# Altium project Ezlo_Voice_AssistantHUB.PrjPcb (part 1 of 10)
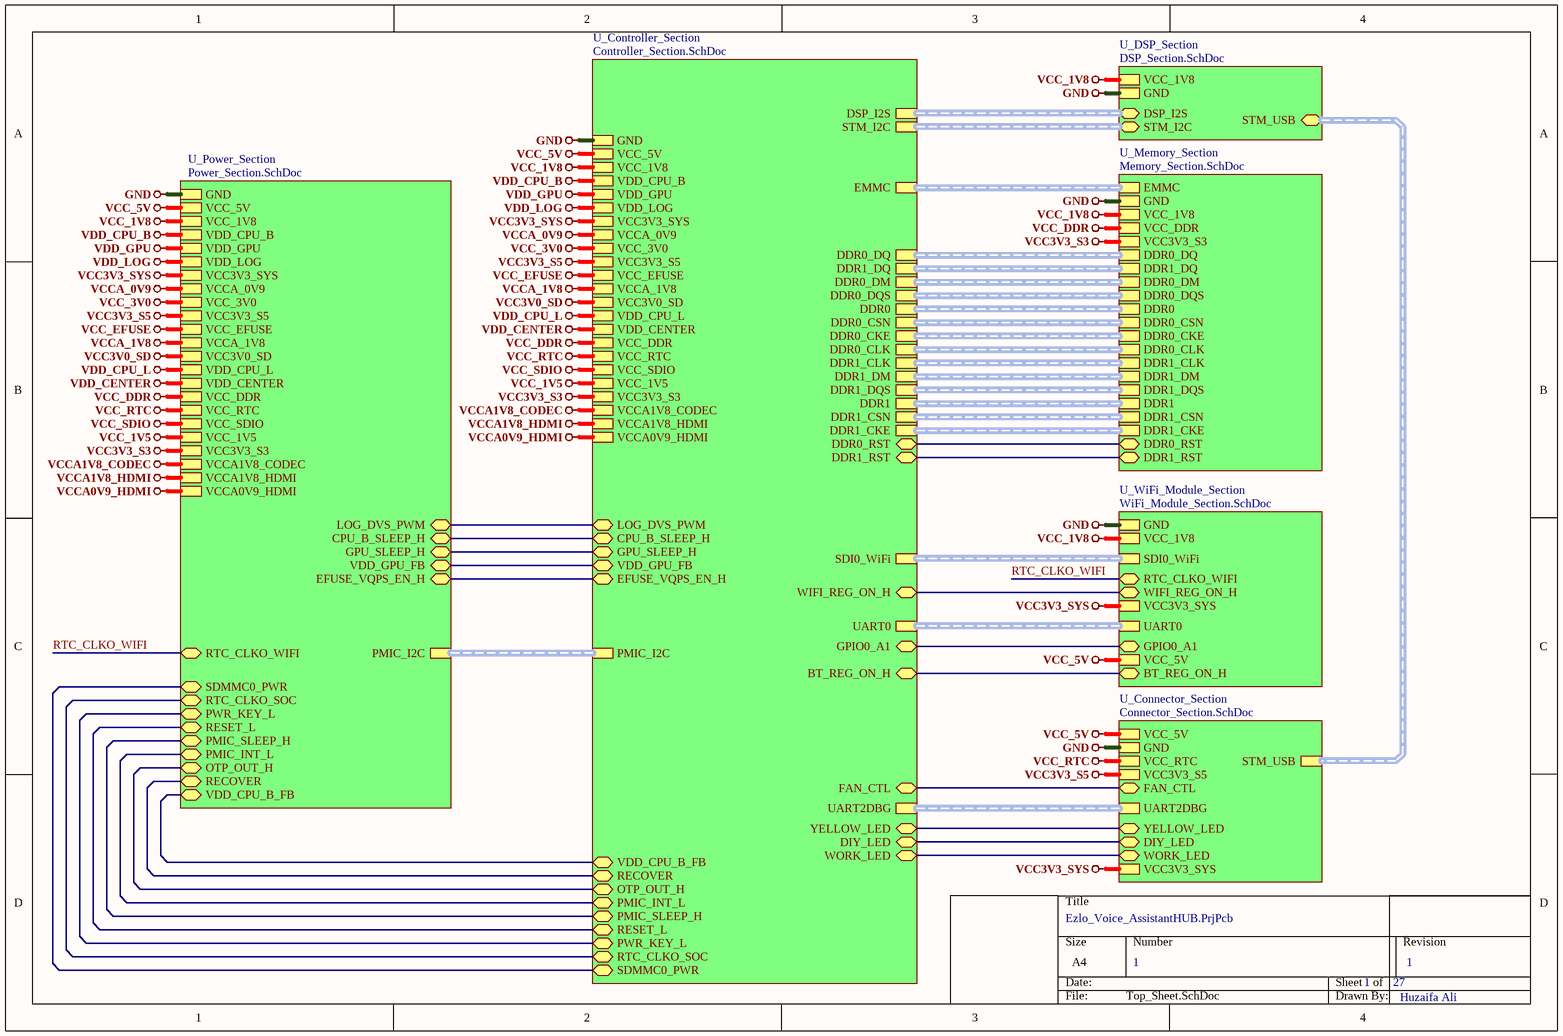
[diagram p0: Top_Sheet.SchDoc]
26 sheets, 569 parts. Net scope: hierarchical (ports join the sheet entries above them; power ports are global).
Board file: VA_HUB_PCB.PcbDoc
Sheets:
  Top_Sheet.SchDoc
    U_DSP_Section = DSP_Section.SchDoc
    U_WiFi_Module_Section = WiFi_Module_Section.SchDoc
    U_Connector_Section = Connector_Section.SchDoc
    U_Power_Section = Power_Section.SchDoc
      U_Power_Sheet_1 = Power_Sheet_1.SchDoc
      U_Power_Sheet_3 = Power_Sheet_3.SchDoc
      U_Power_Sheet_2 = Power_Sheet_2.SchDoc
    U_Controller_Section = Controller_Section.SchDoc
      U_Internal_Power_Sheet = Internal_Power_Sheet.SchDoc
      U_GND_Sheet = GND_Sheet.SchDoc
      U_CameraOrDisplay_Sheet = CameraOrDisplay_Sheet.SchDoc
      U_eMMC_Sheet = eMMC_Sheet.SchDoc
      U_MIPI_Sheet = MIPI_Sheet.SchDoc
      U_PCIe_Sheet = PCIe_Sheet.SchDoc
      U_HDMI_Sheet = HDMI_Sheet.SchDoc
      U_USB_Sheet_2 = USB_Sheet_2.SchDoc
      U_USB_Sheet = USB_Sheet.SchDoc
      U_MISCIO_Sheet = MISCIO_Sheet.SchDoc
      U_Interface_Sheet = Interface_Sheet.SchDoc
      U_SDIO_SDMMC_Sheet = SDIO_SDMMC_Sheet.SchDoc
      U_DDRC_Section = DDRC_Section.SchDoc
      U_DDRC_Sheet_2 = DDRC_Sheet_2.SchDoc
    U_Memory_Section = Memory_Section.SchDoc
      U_Flash_Sheet = Flash_Sheet.SchDoc
      U_RAM_Sheet = RAM_Sheet.SchDoc

## Sheet Top_Sheet.SchDoc
size A4; DocumentNumber: 1; SheetNumber: 1; SheetTotal: 27

### Sub-sheets
U_Connector_Section = Connector_Section.SchDoc: VCC_5V, GND, STM_USB (harness STM_USB), VCC_RTC, VCC3V3_S5, FAN_CTL (bidir), UART2DBG (harness UART2DBG), YELLOW_LED (bidir), DIY_LED (bidir), WORK_LED (bidir), VCC3V3_SYS
U_Controller_Section = Controller_Section.SchDoc: LOG_DVS_PWM (bidir), CPU_B_SLEEP_H (bidir), GPU_SLEEP_H (bidir), VDD_GPU_FB (bidir), EFUSE_VQPS_EN_H (bidir), GND, VCC_5V, VCC_1V8, VDD_CPU_B, VDD_GPU, VDD_LOG, VCC3V3_SYS, VCCA_0V9, VCC_3V0, VCC3V3_S5, VCC_EFUSE, VCCA_1V8, VCC3V0_SD, VDD_CPU_L, VDD_CENTER, VCC_DDR, VCC_RTC, VCC_SDIO, VCC_1V5, VCC3V3_S3, VCCA1V8_CODEC, VCCA1V8_HDMI, VCCA0V9_HDMI, EMMC (harness EMMC), FAN_CTL (bidir), PWR_KEY_L (bidir), PMIC_I2C (harness PMIC_I2C), DSP_I2S (harness DSP_I2S), UART0 (harness UART0), UART2DBG (harness UART2DBG), STM_I2C (harness STM_I2C), OTP_OUT_H (bidir), PMIC_INT_L (bidir), RECOVER (bidir), RTC_CLKO_SOC (bidir), RESET_L (bidir), PMIC_SLEEP_H (bidir), YELLOW_LED (bidir), DIY_LED (bidir), WIFI_REG_ON_H (bidir), GPIO0_A1 (bidir), BT_REG_ON_H (bidir), SDI0_WiFi (harness SDI0_WiFi), WORK_LED (bidir), VDD_CPU_B_FB (bidir), SDMMC0_PWR (bidir), DDR0_DQ, DDR1_DQ, DDR0_DM, DDR0_DQS, DDR0, DDR0_CSN, DDR0_CKE, DDR0_CLK, DDR1_CLK, DDR1_DM, DDR1_DQS, DDR1, DDR1_CSN, DDR1_CKE, DDR0_RST (bidir), DDR1_RST (bidir)
U_DSP_Section = DSP_Section.SchDoc: VCC_1V8, GND, DSP_I2S (bidir, harness DSP_I2S), STM_I2C (bidir, harness STM_I2C), STM_USB (bidir, harness STM_USB)
U_Memory_Section = Memory_Section.SchDoc: EMMC (harness EMMC), GND, VCC_1V8, VCC_DDR, VCC3V3_S3, DDR0_DQ, DDR1_DQ, DDR0_DM, DDR0_DQS, DDR0, DDR0_CSN, DDR0_CKE, DDR0_CLK, DDR1_CLK, DDR1_DM, DDR1_DQS, DDR1, DDR1_CSN, DDR1_CKE, DDR0_RST (bidir), DDR1_RST (bidir)
U_Power_Section = Power_Section.SchDoc: GND, VCC_5V, VCC_1V8, VDD_CPU_B, VDD_GPU, VDD_LOG, VCC3V3_SYS, VCCA_0V9, VCC_3V0, VCC3V3_S5, VCC_EFUSE, VCCA_1V8, VCC3V0_SD, VDD_CPU_L, VDD_CENTER, VCC_DDR, VCC_RTC, VCC_SDIO, VCC_1V5, VCC3V3_S3, VCCA1V8_CODEC, VCCA1V8_HDMI, VCCA0V9_HDMI, PMIC_I2C (harness PMIC_I2C), LOG_DVS_PWM (bidir), CPU_B_SLEEP_H (bidir), GPU_SLEEP_H (bidir), VDD_GPU_FB (bidir), EFUSE_VQPS_EN_H (bidir), RTC_CLKO_WIFI (bidir), RESET_L (bidir), PMIC_SLEEP_H (bidir), PMIC_INT_L (bidir), OTP_OUT_H (bidir), RECOVER (bidir), VDD_CPU_B_FB (bidir), PWR_KEY_L (bidir), RTC_CLKO_SOC (bidir), SDMMC0_PWR (bidir)
U_WiFi_Module_Section = WiFi_Module_Section.SchDoc: GND, VCC_1V8, SDI0_WiFi (harness SDI0_WiFi), RTC_CLKO_WIFI (bidir), WIFI_REG_ON_H (bidir), VCC3V3_SYS, UART0 (harness UART0), GPIO0_A1 (bidir), VCC_5V, BT_REG_ON_H (bidir)

### Nets
GND: sheet U_DSP_Section/GND, sheet U_WiFi_Module_Section/GND, sheet U_Connector_Section/GND, sheet U_Power_Section/GND, sheet U_Controller_Section/GND, sheet U_Memory_Section/GND
VCC3V0_SD: sheet U_Power_Section/VCC3V0_SD, sheet U_Controller_Section/VCC3V0_SD
VCC3V3_S3: sheet U_Power_Section/VCC3V3_S3, sheet U_Controller_Section/VCC3V3_S3, sheet U_Memory_Section/VCC3V3_S3
VCC3V3_S5: sheet U_Connector_Section/VCC3V3_S5, sheet U_Power_Section/VCC3V3_S5, sheet U_Controller_Section/VCC3V3_S5
VCC3V3_SYS: sheet U_WiFi_Module_Section/VCC3V3_SYS, sheet U_Connector_Section/VCC3V3_SYS, sheet U_Power_Section/VCC3V3_SYS, sheet U_Controller_Section/VCC3V3_SYS
VCC_1V5: sheet U_Power_Section/VCC_1V5, sheet U_Controller_Section/VCC_1V5
VCC_1V8: sheet U_DSP_Section/VCC_1V8, sheet U_WiFi_Module_Section/VCC_1V8, sheet U_Power_Section/VCC_1V8, sheet U_Controller_Section/VCC_1V8, sheet U_Memory_Section/VCC_1V8
VCC_3V0: sheet U_Power_Section/VCC_3V0, sheet U_Controller_Section/VCC_3V0
VCC_5V: sheet U_WiFi_Module_Section/VCC_5V, sheet U_Connector_Section/VCC_5V, sheet U_Power_Section/VCC_5V, sheet U_Controller_Section/VCC_5V
VCC_DDR: sheet U_Power_Section/VCC_DDR, sheet U_Controller_Section/VCC_DDR, sheet U_Memory_Section/VCC_DDR
VCC_EFUSE: sheet U_Power_Section/VCC_EFUSE, sheet U_Controller_Section/VCC_EFUSE
VCC_RTC: sheet U_Connector_Section/VCC_RTC, sheet U_Power_Section/VCC_RTC, sheet U_Controller_Section/VCC_RTC
VCC_SDIO: sheet U_Power_Section/VCC_SDIO, sheet U_Controller_Section/VCC_SDIO
VCCA0V9_HDMI: sheet U_Power_Section/VCCA0V9_HDMI, sheet U_Controller_Section/VCCA0V9_HDMI
VCCA1V8_CODEC: sheet U_Power_Section/VCCA1V8_CODEC, sheet U_Controller_Section/VCCA1V8_CODEC
VCCA1V8_HDMI: sheet U_Power_Section/VCCA1V8_HDMI, sheet U_Controller_Section/VCCA1V8_HDMI
VCCA_0V9: sheet U_Power_Section/VCCA_0V9, sheet U_Controller_Section/VCCA_0V9
VCCA_1V8: sheet U_Power_Section/VCCA_1V8, sheet U_Controller_Section/VCCA_1V8
VDD_CENTER: sheet U_Power_Section/VDD_CENTER, sheet U_Controller_Section/VDD_CENTER
VDD_CPU_B: sheet U_Power_Section/VDD_CPU_B, sheet U_Controller_Section/VDD_CPU_B
VDD_CPU_L: sheet U_Power_Section/VDD_CPU_L, sheet U_Controller_Section/VDD_CPU_L
VDD_GPU: sheet U_Power_Section/VDD_GPU, sheet U_Controller_Section/VDD_GPU
VDD_LOG: sheet U_Power_Section/VDD_LOG, sheet U_Controller_Section/VDD_LOG
BT_REG_ON_H: sheet U_WiFi_Module_Section/BT_REG_ON_H, sheet U_Controller_Section/BT_REG_ON_H
CPU_B_SLEEP_H: sheet U_Power_Section/CPU_B_SLEEP_H, sheet U_Controller_Section/CPU_B_SLEEP_H
DDR0_RST: sheet U_Controller_Section/DDR0_RST, sheet U_Memory_Section/DDR0_RST
DDR1_RST: sheet U_Controller_Section/DDR1_RST, sheet U_Memory_Section/DDR1_RST
DIY_LED: sheet U_Connector_Section/DIY_LED, sheet U_Controller_Section/DIY_LED
EFUSE_VQPS_EN_H: sheet U_Power_Section/EFUSE_VQPS_EN_H, sheet U_Controller_Section/EFUSE_VQPS_EN_H
FAN_CTL: sheet U_Connector_Section/FAN_CTL, sheet U_Controller_Section/FAN_CTL
GPIO0_A1: sheet U_WiFi_Module_Section/GPIO0_A1, sheet U_Controller_Section/GPIO0_A1
GPU_SLEEP_H: sheet U_Power_Section/GPU_SLEEP_H, sheet U_Controller_Section/GPU_SLEEP_H
LOG_DVS_PWM: sheet U_Power_Section/LOG_DVS_PWM, sheet U_Controller_Section/LOG_DVS_PWM
OTP_OUT_H: sheet U_Power_Section/OTP_OUT_H, sheet U_Controller_Section/OTP_OUT_H
PMIC_INT_L: sheet U_Power_Section/PMIC_INT_L, sheet U_Controller_Section/PMIC_INT_L
PMIC_SLEEP_H: sheet U_Power_Section/PMIC_SLEEP_H, sheet U_Controller_Section/PMIC_SLEEP_H
PWR_KEY_L: sheet U_Power_Section/PWR_KEY_L, sheet U_Controller_Section/PWR_KEY_L
RECOVER: sheet U_Power_Section/RECOVER, sheet U_Controller_Section/RECOVER
RESET_L: sheet U_Power_Section/RESET_L, sheet U_Controller_Section/RESET_L
RTC_CLKO_SOC: sheet U_Power_Section/RTC_CLKO_SOC, sheet U_Controller_Section/RTC_CLKO_SOC
RTC_CLKO_WIFI: sheet U_WiFi_Module_Section/RTC_CLKO_WIFI, sheet U_Power_Section/RTC_CLKO_WIFI
SDMMC0_PWR: sheet U_Power_Section/SDMMC0_PWR, sheet U_Controller_Section/SDMMC0_PWR
VDD_CPU_B_FB: sheet U_Power_Section/VDD_CPU_B_FB, sheet U_Controller_Section/VDD_CPU_B_FB
VDD_GPU_FB: sheet U_Power_Section/VDD_GPU_FB, sheet U_Controller_Section/VDD_GPU_FB
WIFI_REG_ON_H: sheet U_WiFi_Module_Section/WIFI_REG_ON_H, sheet U_Controller_Section/WIFI_REG_ON_H
WORK_LED: sheet U_Connector_Section/WORK_LED, sheet U_Controller_Section/WORK_LED
YELLOW_LED: sheet U_Connector_Section/YELLOW_LED, sheet U_Controller_Section/YELLOW_LED

### Buses and harness runs
harness sheet U_Connector_Section/STM_USB = sheet U_DSP_Section/STM_USB
harness sheet U_Connector_Section/UART2DBG = sheet U_Controller_Section/UART2DBG
harness sheet U_Controller_Section/DDR0 = sheet U_Memory_Section/DDR0
harness sheet U_Controller_Section/DDR0_CKE = sheet U_Memory_Section/DDR0_CKE
harness sheet U_Controller_Section/DDR0_CLK = sheet U_Memory_Section/DDR0_CLK
harness sheet U_Controller_Section/DDR0_CSN = sheet U_Memory_Section/DDR0_CSN
harness sheet U_Controller_Section/DDR0_DM = sheet U_Memory_Section/DDR0_DM
harness sheet U_Controller_Section/DDR0_DQ = sheet U_Memory_Section/DDR0_DQ
harness sheet U_Controller_Section/DDR0_DQS = sheet U_Memory_Section/DDR0_DQS
harness sheet U_Controller_Section/DDR1 = sheet U_Memory_Section/DDR1
harness sheet U_Controller_Section/DDR1_CKE = sheet U_Memory_Section/DDR1_CKE
harness sheet U_Controller_Section/DDR1_CLK = sheet U_Memory_Section/DDR1_CLK
harness sheet U_Controller_Section/DDR1_CSN = sheet U_Memory_Section/DDR1_CSN
harness sheet U_Controller_Section/DDR1_DM = sheet U_Memory_Section/DDR1_DM
harness sheet U_Controller_Section/DDR1_DQ = sheet U_Memory_Section/DDR1_DQ
harness sheet U_Controller_Section/DDR1_DQS = sheet U_Memory_Section/DDR1_DQS
harness sheet U_Controller_Section/DSP_I2S = sheet U_DSP_Section/DSP_I2S
harness sheet U_Controller_Section/EMMC = sheet U_Memory_Section/EMMC
harness sheet U_Controller_Section/PMIC_I2C = sheet U_Power_Section/PMIC_I2C
harness sheet U_Controller_Section/SDI0_WiFi = sheet U_WiFi_Module_Section/SDI0_WiFi
harness sheet U_Controller_Section/STM_I2C = sheet U_DSP_Section/STM_I2C
harness sheet U_Controller_Section/UART0 = sheet U_WiFi_Module_Section/UART0

### Notes on the sheet
- 1
- Huzaifa Ali

## Sheet DSP_Section.SchDoc
size A4; DocumentNumber: 22; SheetNumber: 22; SheetTotal: 27
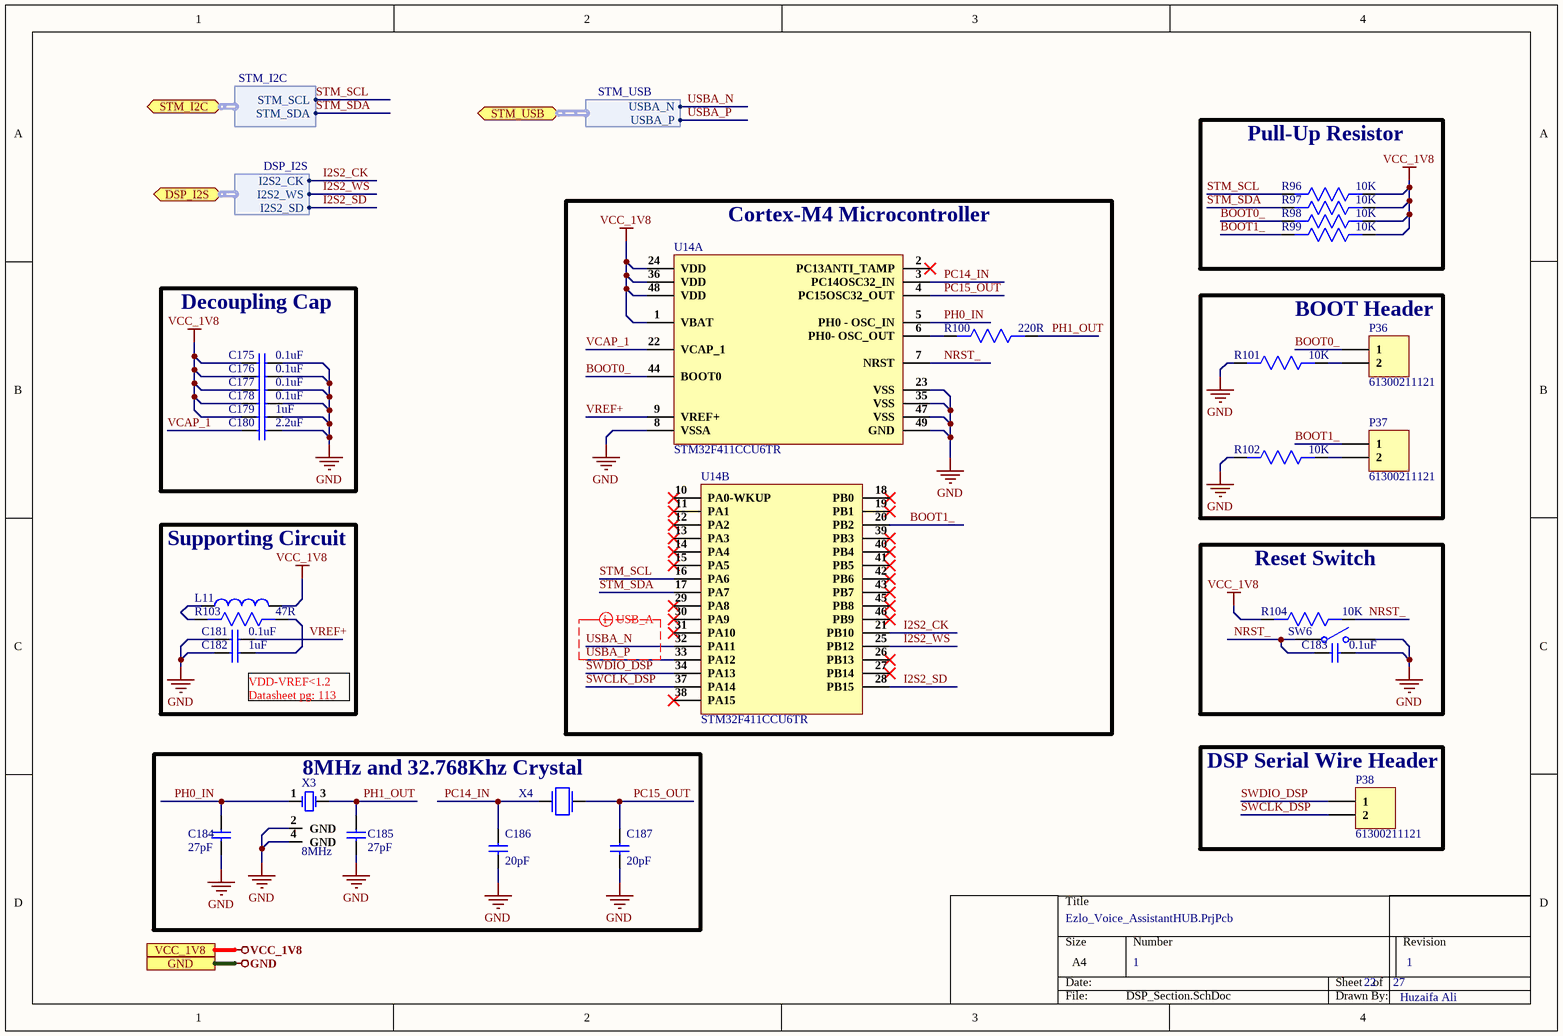
[diagram p1: DSP_Section.SchDoc]

### Parts
C175  0.1uF  [Cap0402]
C176  0.1uF  [Cap0402]
C177  0.1uF  [Cap0402]
C178  0.1uF  [Cap0402]
C179  1uF  [Cap0402]
C180  2.2uF  [Cap0603]
C181  0.1uF  [Cap0402]
C182  1uF  [Cap0402]
C183  0.1uF  [Cap0402]
C184  27pF  [Cap0603]
C185  27pF  [Cap0603]
C186  20pF  [Cap0603]
C187  20pF  [Cap0603]
L11  BLM15AG601SN1D  [IND 0402]  (value not drawn)
P36  61300211121  [HDR1X2]
P37  61300211121  [HDR1X2]
P38  61300211121  [HDR1X2]
R96  10K  [Res0603]
R97  10K  [Res0603]
R98  10K  [Res0603]
R99  10K  [Res0603]
R100  220R  [Res0603]
R101  10K  [Res0603]
R102  10K  [Res0603]
R103  47R  [Res0603]
R104  10K  [Res0603]
SW6  TS-1185EC-C-D-B  [TS-1185EC-C-D-B]  (value not drawn)
U14  STM32F411CCU6TR  [48-UFQFPN (7x7)]  (parts A,B of 2)
X3  8MHz  [5TJ480000XYLBC]
X4  NX3215SA-32.768K-STD-MUA-8  [NX3215SA-32.768K-STD-MUA-8]  (value not drawn)

### Blocks framed on the sheet
Pull-Up Resistor: R96-R99
Cortex-M4 Microcontroller: R100 U14
Decoupling Cap: C175-C180
BOOT Header: P36 P37 R101 R102
Supporting Circuit: C181 C182 L11 R103
Reset Switch: C183 R104 SW6
8MHz and 32.768Khz Crystal: C184-C187 X3 X4
DSP Serial Wire Header: P38

### Ports
DSP_I2S (bidir, harness DSP_I2S), GND, STM_I2C (bidir, harness STM_I2C), STM_USB (bidir, harness STM_USB), VCC_1V8

### Harnesses
DSP_I2S: I2S2_CK, I2S2_WS, I2S2_SD
STM_I2C: STM_SCL, STM_SDA
STM_USB: USBA_N, USBA_P

### Nets
GND: C175.2 C176.2 C177.2 C178.2 C179.2 C180.2 C181.1 C182.1 C183.2 C184.1 C185.1 C186.1 C187.1 R101.2 R102.2 SW6.2 U14.8(VSSA) U14.23(VSS) U14.35(VSS) U14.47(VSS) U14.49(GND) X3.2(GND) X3.4(GND) ; port GND
VCC_1V8: C175.1 C176.1 C177.1 C178.1 C179.1 L11.2 R96.1 R97.1 R98.1 R99.1 R104.2 U14.1(VBAT) U14.24(VDD) U14.36(VDD) U14.48(VDD) ; port VCC_1V8
BOOT0_: P36.1 R98.2 U14.44(BOOT0)
BOOT1_: P37.1 R99.2 U14.20(PB2)
I2S2_CK: U14.21(PB10) ; port DSP_I2S.I2S2_CK  [project net DSP_I2S.I2S2_CK]
I2S2_SD: U14.28(PB15) ; port DSP_I2S.I2S2_SD  [project net DSP_I2S.I2S2_SD]
I2S2_WS: U14.25(PB12) ; port DSP_I2S.I2S2_WS  [project net DSP_I2S.I2S2_WS]
NRST_: C183.1 R104.1 SW6.1 U14.7(NRST)
PC14_IN: C186.2 U14.3(PC14OSC32_IN) X4.2
PC15_OUT: C187.2 U14.4(PC15OSC32_OUT) X4.1
PH0_IN: C184.2 U14.5(PH0_-_OSC_IN) X3.1(OSC1)
PH1_OUT: C185.2 R100.1 X3.3(OSC2)
STM_SCL: R96.2 U14.16(PA6) ; port STM_I2C.STM_SCL  [project net STM_I2C.STM_SCL]
STM_SDA: R97.2 U14.17(PA7) ; port STM_I2C.STM_SDA  [project net STM_I2C.STM_SDA]
SWCLK_DSP: P38.2 U14.37(PA14)
SWDIO_DSP: P38.1 U14.34(PA13)
USBA_N: U14.32(PA11) ; port STM_USB.USBA_N
USBA_P: U14.33(PA12) ; port STM_USB.USBA_P
VCAP_1: C180.1 U14.22(VCAP_1)
VREF+: C181.2 U14.9(VREF+)
NetC182_2: C182.2 R103.1
NetL11_1: L11.1 R103.2
NetP36_2: P36.2 R101.1
NetP37_2: P37.2 R102.1
NetR100_2: R100.2 U14.6(PH0-_OSC_OUT)

Not connected (* = marked no-connect by the designer): U14 2(PC13ANTI_TAMP)* 10(PA0-WKUP)* 11(PA1)* 12(PA2)* 13(PA3)* 14(PA4)* 15(PA5)* 18(PB0)* 19(PB1)* 26(PB13)* 27(PB14)* 29(PA8)* 30(PA9)* 31(PA10)* 38(PA15)* 39(PB3)* 40(PB4)* 41(PB5)* 42(PB6)* 43(PB7)* 45(PB8)* 46(PB9)*

### Layout directives
differential pair; rule Matched Net Lengths [Tolerance = 50mil]; rule Impedance Constraint [Min = 85.00    Max = 95.00    ]; differential pair class USB_A_Lines; net class USB_A: USBA_N, USBA_P

### Notes on the sheet
- VDD-VREF<1.2
  Datasheet pg: 113
- 1
- Huzaifa Ali

### Library data of the parts
C175-C178 C181 C183 = CC0402KRX5R6BB104: CAP CER 0.1UF 10V X5R 0402; Manufacturer: Yageo; Capacitance: 100nF; Tolerance: 10%; Dissipation Factor: 5%; Insulation Resistance: 10GR; Supplier 1: Digi-Key; Manufacturer Part Number: CC0402KRX5R6BB104; RoHS: Yes; Category: Ceramic Capacitors; Stock 1: 6385580; Pricing 1: 1=0.10000, 10=0.02700, 50=0.01500, 100=0.01220, 500=0.00874, 1000=0.00687, 2500=0.00625, 5000=0.00575 (USD); Mount: Surface Mount; Case/Package: 0402; Number of Pins: 2; Case Code (Imperial): 0402; Case Code (Metric): 1005; Min Operating Temperature: -55°C; Max Operating Temperature: 85°C; Dielectric: X5R; Packaging: Tape and Reel; Voltage Rating: 10V; Package Quantity: 1; Termination: SMD/SMT; Voltage Rating (DC): 10V; Series: CC; Length: 1mm; Width: 0.02inch; Height: 0.5mm; Depth: 0.5mm; Thickness: 0.022inch; Radiation Hardening: No; RoHS Compliant: Yes; REACH SVHC: No SVHC; Lead Free: Lead Free; Halogen Free: Halogen Free; ComponentLink1URL: https://datasheet.ciiva.com/144/mlccorderingcode-144029.pdf?src-supplier=Digi-Key; ComponentLink1Description: https://datasheet.ciiva.com/144/mlccorderingcode-144029.pdf?src-supplier=Digi-Key; ComponentLink2URL: https://datasheet.ciiva.com/144/mlccorderingcode-144028.pdf?src-supplier=Digi-Key; ComponentLink2Description: https://datasheet.ciiva.com/144/mlccorderingcode-144028.pdf?src-supplier=Digi-Key; ComponentLink3URL: https://datasheet.ciiva.com/144/mlccorderingcode-144030.pdf?src-supplier=Digi-Key; ComponentLink3Description: https://datasheet.ciiva.com/144/mlccorderingcode-144030.pdf?src-supplier=Digi-Key; ComponentLink4URL: https://datasheet.ciiva.com/7978/1359354-7978091.pdf?src-supplier=Element14; ComponentLink4Description: https://datasheet.ciiva.com/7978/1359354-7978091.pdf?src-supplier=Element14; ComponentLink5URL: https://datasheet.ciiva.com/11587/upy-gphc-x5r-4v-to-50v-12-11587302.pdf?src-supplier=Avnet; ComponentLink5Description: https://datasheet.ciiva.com/11587/upy-gphc-x5r-4v-to-50v-12-11587302.pdf?src-supplier=Avnet; Supplier Part Number 1: 311-1336-1-ND
C179 C182 = GRM155R61E105KA12D: CAP CER 1UF 25V X5R 0402; Manufacturer: Murata; Material: Ceramic; Tolerance: 10%; Supplier 1: Digi-Key; Manufacturer Part Number: GRM155R61E105KA12D; Stock 1: 1194305; Pricing 1: 1=0.11, 10=0.077, 100=0.0363, 500=0.02546, 1000=0.02108, 2500=0.01962, 5000=0.01795 (USD); Mount: Surface Mount; Case/Package: 0402; Weight: 0.000212oz; Case Code (Metric): 1005; Case Code (Imperial): 0402; Min Operating Temperature: -55°C; Max Operating Temperature: 85°C; Capacitance: 1uF; Voltage Rating: 25V; Packaging: Tape and Reel; Dielectric: X5R; Voltage: 25V; Termination: SMD/SMT; Voltage Rating (DC): 25V; Package Quantity: 10000; Length: 1mm; Height: 0.5mm; Width: 0.5mm; Thickness: 0.022inch; Depth: 0.5mm; REACH SVHC: No SVHC; Lead Free: Lead Free; ComponentLink1URL: http://www.farnell.com/datasheets/2048341.pdf?src-supplier=Element14; ComponentLink1Description: http://www.farnell.com/datasheets/2048341.pdf?src-supplier=Element14; Supplier Part Number 1: 490-10017-1-ND
C180 = CL10A225KA8NNNC: CAP CER 2.2UF 25V X5R 0603; Manufacturer: Samsung; Tolerance: 10%; Supplier 1: Digi-Key; Manufacturer Part Number: CL10A225KA8NNNC; RoHS: Yes; Category: Ceramic Capacitors; Stock 1: 168888; Pricing 1: 1=0.22000, 10=0.15000, 50=0.09000, 100=0.07610, 500=0.05206, 1000=0.04605 (USD); Mount: Surface Mount; Case/Package: 0603; Case Code (Metric): 1608; Case Code (Imperial): 0603; Min Operating Temperature: -55°C; Max Operating Temperature: 85°C; Capacitance: 2.2uF; Packaging: Tape and Reel; Package Quantity: 1; Voltage Rating: 25V; Dielectric: X5R; Voltage Rating (DC): 25V; Series: CL; Construction: Flat; Length: 1.6mm; Width: 0.031inch; Height: 0.8mm; Thickness: 0.035inch; Depth: 0.8mm; Radiation Hardening: No; Lead Free: Lead Free; RoHS Compliant: Yes; ComponentLink1URL: https://datasheet.ciiva.com/25797/cl10a225ka8nnnc-25797781.pdf?src-supplier=Digi-Key; ComponentLink1Description: https://datasheet.ciiva.com/25797/cl10a225ka8nnnc-25797781.pdf?src-supplier=Digi-Key; Supplier Part Number 1: 1276-1879-1-ND
C184 C185 = CC0603JRNPO9BN270: CAP CER 27pF 5% C0G 50V 0603 Paper T/R; Manufacturer: Yageo; Dielectric Material: Ceramic; Tolerance: 10%; Temperature Coefficient: 0ppm/°C; Insulation Resistance: 100GR; Supplier 1: Arrow Electronics; Manufacturer Part Number: CC0603JRNPO9BN270; RoHS: Yes; Category: Ceramic Capacitors; Stock 1: 16000; Pricing 1: 4000=0.00800, 8000=0.00610 (USD); Mount: Surface Mount; Case/Package: 0603; Number of Pins: 2; Case Code (Metric): 1608; Case Code (Imperial): 0603; Min Operating Temperature: -55°C; Max Operating Temperature: 125°C; Capacitance: 27pF; Dielectric: C0G; Package Quantity: 1; Voltage Rating: 50V; Packaging: Tape and Reel; Voltage Rating (DC): 50V; Termination: SMD/SMT; Resistor Type: Ceramic; Voltage: 50V; Series: CC; Length: 1.6mm; Width: 0.031inch; Height: 0.8mm; Thickness: 0.035inch; Depth: 0.8mm; Radiation Hardening: No; REACH SVHC: Unknown; Lead Free: Lead Free; RoHS Compliant: Yes; ComponentLink1URL: https://datasheet.ciiva.com/26862/getdatasheetpartid-403529-26862764.pdf?src-supplier=Verical; ComponentLink1Description: https://datasheet.ciiva.com/26862/getdatasheetpartid-403529-26862764.pdf?src-supplier=Verical; ComponentLink2URL: https://datasheet.ciiva.com/8033/1443161-8033757.pdf?src-supplier=Element14; ComponentLink2Description: https://datasheet.ciiva.com/8033/1443161-8033757.pdf?src-supplier=Element14; ComponentLink3URL: https://datasheet.ciiva.com/46430/1835847-46430154.pdf?src-supplier=Element14; ComponentLink3Description: https://datasheet.ciiva.com/46430/1835847-46430154.pdf?src-supplier=Element14; ComponentLink4URL: https://datasheet.ciiva.com/144/mlccorderingcode-144641.pdf?src-supplier=Digi-Key; ComponentLink4Description: https://datasheet.ciiva.com/144/mlccorderingcode-144641.pdf?src-supplier=Digi-Key; ComponentLink5URL: https://datasheet.ciiva.com/144/mlccorderingcode-144640.pdf?src-supplier=Digi-Key; ComponentLink5Description: https://datasheet.ciiva.com/144/mlccorderingcode-144640.pdf?src-supplier=Digi-Key; ComponentLink6URL: https://datasheet.ciiva.com/144/mlccorderingcode-144642.pdf?src-supplier=Digi-Key; ComponentLink6Description: https://datasheet.ciiva.com/144/mlccorderingcode-144642.pdf?src-supplier=Digi-Key; ComponentLink7URL: https://datasheet.ciiva.com/8033/1734582-8033726.pdf?src-supplier=Element14; ComponentLink7Description: https://datasheet.ciiva.com/8033/1734582-8033726.pdf?src-supplier=Element14; ComponentLink8URL: https://datasheet.ciiva.com/8033/1734582-8033725.pdf?src-supplier=Element14; ComponentLink8Description: https://datasheet.ciiva.com/8033/1734582-8033725.pdf?src-supplier=Element14; ComponentLink9URL: https://datasheet.ciiva.com/11464/upy-gp-np0-16v-to-50v-8-11464729.pdf?src-supplier=Avnet; ComponentLink9Description: https://datasheet.ciiva.com/11464/upy-gp-np0-16v-to-50v-8-11464729.pdf?src-supplier=Avnet; Supplier Part Number 1: CC0603JRNPO9BN270
C186 C187 = CC0603JRNPO9BN200: CAP CER 20PF 50V C0G/NPO 0603; Manufacturer: Yageo; Tolerance: 5%; Dielectric: C0G; Supplier 1: Digi-Key; Manufacturer Part Number: CC0603JRNPO9BN200; Stock 1: 259568; Pricing 1: 1=0.1, 10=0.048, 100=0.0214, 500=0.01526, 1000=0.01198 (USD); Mount: Surface Mount; Case/Package: 0603; Number of Pins: 2; Weight: 7.1E-05oz; Case Code (Imperial): 0603; Case Code (Metric): 1608; Min Operating Temperature: -55°C; Max Operating Temperature: 125°C; Capacitance: 20pF; Package Quantity: 4000; Voltage Rating (DC): 50V; Packaging: Tape and Reel; Voltage Rating: 50V; Termination: SMD/SMT; Composition: Ceramic; Length: 1.6mm; Width: 0.8mm; Thickness: 0.035inch; Depth: 0.8mm; REACH SVHC: Unknown; Lead Free: Lead Free; ComponentLink1URL: http://www.farnell.com/datasheets/1132289.pdf?src-supplier=Element14; ComponentLink1Description: http://www.farnell.com/datasheets/1132289.pdf?src-supplier=Element14; ComponentLink2URL: http://www.yageo.com/documents/recent/UPY-GP_NP0_16V-to-50V_16.pdf?src-supplier=Digi-Key; ComponentLink2Description: http://www.yageo.com/documents/recent/UPY-GP_NP0_16V-to-50V_16.pdf?src-supplier=Digi-Key; Supplier Part Number 1: 311-1424-6-ND
L11 = BLM15AG601SN1D: Ferrite Beads Multi-Layer 600Ohm 25% 100MHz 300mA 520mOhm DCR 0402 Paper T/R; Manufacturer: Murata; Material: Steel,Ferrite; Impedance: 600R; DC Resistance (DCR): 520mR; Number of Lines: 1; Shielding: Unshielded; DC Resistance-Max: 600mR; Supplier 1: Digi-Key; Manufacturer Part Number: BLM15AG601SN1D; RoHS: Yes; Category: Inductors; Stock 1: 4108655; Pricing 1: 1=0.10000, 10=0.06500, 25=0.05760, 50=0.05240, 100=0.04710, 250=0.03456, 500=0.02514, 1000=0.02461, 5000=0.01676 (USD); Case/Package: 0402; Number of Pins: 2; Core Material: Ferrite; Case Code (Metric): 1005; Case Code (Imperial): 0402; Min Operating Temperature: -55°C; Max Operating Temperature: 125°C; Tolerance: 25%; Max DC Current: 300mA; Package Quantity: 10000; Packaging: Tape and Reel; Current Rating: 300mA; Max Current Rating: 300mA; Termination: SMD/SMT; Test Frequency: 100MHz; DC Current: 300mA; Frequency: 100MHz; Number of Circuits: 1; Series: BLM15AG_SN; Length: 1mm; Width: 0.5mm; Height: 0.5mm; Depth: 0.55mm; Radiation Hardening: No; REACH SVHC: No SVHC; Military Standard: Not; Lead Free: Lead Free; RoHS Compliant: Yes; ComponentLink1URL: https://datasheet.ciiva.com/11799/0900766b811b5866-11799226.pdf?src-supplier=RSComponents; ComponentLink1Description: https://datasheet.ciiva.com/11799/0900766b811b5866-11799226.pdf?src-supplier=RSComponents; ComponentLink2URL: https://datasheet.ciiva.com/41449/001172163-da-01-en-drossel-0402-600r-1-0x0-5mm-10000st-41449450.pdf?src-supplier=Conrad; ComponentLink2Description: https://datasheet.ciiva.com/41449/001172163-da-01-en-drossel-0402-600r-1-0x0-5mm-10000st-41449450.pdf?src-supplier=Conrad; ComponentLink3URL: https://datasheet.ciiva.com/29347/442210-da-01-en-chip-drossel-0402-600r-300ma-1-0x0-5mm-29347879.pdf?src-supplier=Conrad; ComponentLink3Description: https://datasheet.ciiva.com/29347/442210-da-01-en-chip-drossel-0402-600r-300ma-1-0x0-5mm-29347879.pdf?src-supplier=Conrad; ComponentLink4URL: https://datasheet.ciiva.com/1466/5144-1466744.pdf?src-supplier=Element14; ComponentLink4Description: https://datasheet.ciiva.com/1466/5144-1466744.pdf?src-supplier=Element14; ComponentLink5URL: https://datasheet.ciiva.com/1466/5144-1466745.pdf?src-supplier=Element14; ComponentLink5Description: https://datasheet.ciiva.com/1466/5144-1466745.pdf?src-supplier=Element14; ComponentLink6URL: https://datasheet.ciiva.com/14122/blm-series-eng-tds-14122894.pdf?src-supplier=Distrelec; ComponentLink6Description: https://datasheet.ciiva.com/14122/blm-series-eng-tds-14122894.pdf?src-supplier=Distrelec; ComponentLink7URL: https://datasheet.ciiva.com/6212/l0110s0100blm15ag-sn-6212519.pdf?src-supplier=Digi-Key; ComponentLink7Description: https://datasheet.ciiva.com/6212/l0110s0100blm15ag-sn-6212519.pdf?src-supplier=Digi-Key; ComponentLink8URL: https://datasheet.ciiva.com/6212/l0110s0100blm15ag-sn-6212565.pdf?src-supplier=Digi-Key; ComponentLink8Description: https://datasheet.ciiva.com/6212/l0110s0100blm15ag-sn-6212565.pdf?src-supplier=Digi-Key; ComponentLink9URL: https://datasheet.ciiva.com/6212/l0110s0100blm15ag-sn-6212520.pdf?src-supplier=Digi-Key; ComponentLink9Description: https://datasheet.ciiva.com/6212/l0110s0100blm15ag-sn-6212520.pdf?src-supplier=Digi-Key; ComponentLink10URL: https://datasheet.ciiva.com/8084/l0110s0100blm15ag-sn-8084271.pdf?src-supplier=Avnet; ComponentLink10Description: https://datasheet.ciiva.com/8084/l0110s0100blm15ag-sn-8084271.pdf?src-supplier=Avnet; ComponentLink11URL: https://datasheet.ciiva.com/8510/l0110s0100blm15ag-sn-8510909.pdf?src-supplier=Avnet; ComponentLink11Description: https://datasheet.ciiva.com/8510/l0110s0100blm15ag-sn-8510909.pdf?src-supplier=Avnet; Supplier Part Number 1: 490-1006-1-ND
P36-P38 = 61300211121: CONN HEADER VERT 2POS 2.54MM; Manufacturer: Wurth Electronics; Current Rating: 3A; Voltage Rating: 250V; Number of Positions: 2; Gender: Male; Connector Type: Male Pin; Pitch: 0.1inch; Supplier 1: Digi-Key; Manufacturer Part Number: 61300211121; Stock 1: 219205; Pricing 1: 1=0.13, 10=0.106, 25=0.088, 50=0.074, 100=0.067, 1000=0.061 (USD); Mount: Through Hole; Contact Plating: Gold; Housing Material: PBT; Contact Material: Copper Alloy,Copper; Color: Black; Min Operating Temperature: -40°C; Max Operating Temperature: 125°C; Number of Rows: 1; Contact Gender: Male; Packaging: Bulk; Termination: Through Hole; Number of Contacts: 2; Contact Mating Length: 0.236inch; REACH SVHC: Unknown; Lead Free: Lead Free; ComponentLink1URL: http://www.mouser.com/ds/2/445/6130xx11121-538006.pdf?src-supplier=Mouser; ComponentLink1Description: http://www.mouser.com/ds/2/445/6130xx11121-538006.pdf?src-supplier=Mouser; Supplier Part Number 1: 732-5315-ND
R96-R99 R101 R102 R104 = AC0603JR-0710KL: RES SMD 10K OHM 5% 1/10W 0603; Manufacturer: Yageo; Voltage Rating: 50V; Resistance: 10kR; Power Rating: 100mW; Temperature Coefficient: 100ppm/°C; Supplier 1: Future Electronics; Manufacturer Part Number: AC0603JR-0710KL; RoHS: Yes; Category: Chip SMD Resistors; Stock 1: 1533000; Pricing 1: 5000=0.00540 (USD); Case/Package: 0603; Case Code (Imperial): 0603; Case Code (Metric): 1608; Size Code: 0603; Min Operating Temperature: -55°C; Max Operating Temperature: 155°C; Packaging: Tape and Reel; Tolerance: 5%; Package Quantity: 1; Resistor Type: Thick Film; Termination: SMD/SMT; Number of Terminations: 2; Max Power Dissipation: 100mW; Features: Moisture Resistant,Automotive AEC-Q200,Anti-Sulfur; Series: AC; Construction: Rectangular; Length: 0.063inch; Width: 0.031inch; Height: 0.022inch; Depth: 0.8mm; Military Standard: Not; Lead Free: Lead Free; RoHS Compliant: Yes; ComponentLink1URL: https://datasheet.ciiva.com/5562/pyu-ac-51-rohs-l-2-5562553.pdf?src-supplier=Mouser; ComponentLink1Description: https://datasheet.ciiva.com/5562/pyu-ac-51-rohs-l-2-5562553.pdf?src-supplier=Mouser; Supplier Part Number 1: 1029044
R100 = RC0603FR-07220RL: RES SMD 220 OHM 1% 1/10W 0603; Manufacturer: Yageo; Temperature Coefficient: 100ppm/°C; Voltage Rating (DC): 50V; Power Rating: 100mW; Supplier 1: Digi-Key; Manufacturer Part Number: RC0603FR-07220RL; Stock 1: 5843995; Pricing 1: 1=0.1, 10=0.023, 100=0.0094, 1000=0.00421, 2500=0.00366 (USD); Case/Package: 0603; Number of Pins: 2; Case Code (Imperial): 0603; Case Code (Metric): 1608; Min Operating Temperature: -55°C; Max Operating Temperature: 155°C; Resistance: 220R; Tolerance: 1%; Composition: Thick Film; Packaging: Tape and Reel; Voltage Rating: 50V; Package Quantity: 1; Termination: SMD/SMT; Number of Terminations: 2; Military Standard: Not; Max Power Dissipation: 100mW; Features: Moisture Resistant; Length: 1.6mm; Height: 0.022inch; Width: 0.031inch; Depth: 0.8mm; REACH SVHC: No SVHC; Lead Free: Lead Free; ComponentLink1URL: http://www.yageo.com/documents/recent/PYu-RC_Group_51_RoHS_L_10.pdf?src-supplier=Digi-Key; ComponentLink1Description: http://www.yageo.com/documents/recent/PYu-RC_Group_51_RoHS_L_10.pdf?src-supplier=Digi-Key; ComponentLink2URL: http://www.farnell.com/datasheets/1868787.pdf?src-supplier=Element14; ComponentLink2Description: http://www.farnell.com/datasheets/1868787.pdf?src-supplier=Element14; Supplier Part Number 1: 311-220HRCT-ND
R103 = AR03BTDX0470: 100mW Thin Film Resistor 50V ±0.1% ±50ppm/℃ -55℃~+155℃ 47Ω 0603 Chip Resistor - Surface Mount ROHS; Manufacturer: Viking; Manufacturer Part Number: AR03BTDX0470; Value: 47R; ComponentLink1Description: LCSC; ComponentLink1URL: https://lcsc.com/product-detail/Chip-span-style-background-color-ff0-Resistor-span-Surface-Mount_Viking-Tech-AR03BTDX0470_C319577.html; Footprint: 0603
SW6 = TS-1185EC-C-D-B: 3mm 2mm Round Button 50mA Top3.65mm SPST 12V SMD Tactile Switches; Manufacturer: XKB; Manufacturer Part Number: TS-1185EC-C-D-B; Footprint: Custom; ComponentLink1Description: LCSC; ComponentLink1URL: https://lcsc.com/product-detail/Tactile-Switches_XKB-Connectivity-TS-1185EC-C-D-B_C318893.html
U14 = STM32F411CCU6TR: IC MCU 32BIT 256KB FLSH 48UFQFPN; Manufacturer: STMicroelectronics; Interface: I2C,SPI,USB,IrDA,MMC,SDIO,SD,UART,USART; Peripherals: Brown-out Detect/Reset,POR,PWM,WDT,DMA; Memory Type: FLASH; Core Architecture: ARM; Frequency: 100MHz; Number of I/Os: 36; Oscillator Type: Internal; Supplier 1: Digi-Key; Manufacturer Part Number: STM32F411CCU6TR; RoHS: Yes; Category: Microcontrollers; Pricing 1: 1=8.30000, 10=7.49700, 25=7.14840, 100=6.20680, 250=5.92784, 500=5.81160 (USD); Case/Package: UFQFPN; Min Operating Temperature: -40°C; Max Operating Temperature: 85°C; Packaging: Tape and Reel; Memory Size: 256KB; RoHS Compliant: Yes; ComponentLink1URL: http://www.mouser.com/ds/2/389/stm32f411ce-956237.pdf?src-supplier=Mouser; ComponentLink1Description: http://www.mouser.com/ds/2/389/stm32f411ce-956237.pdf?src-supplier=Mouser; ComponentLink2URL: http://www.farnell.com/datasheets/2815955.pdf?src-supplier=Farnell; ComponentLink2Description: http://www.farnell.com/datasheets/2815955.pdf?src-supplier=Farnell; ComponentLink3URL: http://www.st.com/content/ccc/resource/technical/document/datasheet/b3/a5/46/3b/b4/e5/4c/85/DM00115249.pdf/files/DM00115249.pdf/jcr:content/translations/en.DM00115249.pdf?src-supplier=Digi-Key; ComponentLink3Description: http://www.st.com/content/ccc/resource/technical/document/datasheet/b3/a5/46/3b/b4/e5/4c/85/DM00115249.pdf/files/DM00115249.pdf/jcr:content/translations/en.DM00115249.pdf?src-supplier=Digi-Key; ComponentLink4URL: http://www.farnell.com/datasheets/2815955.pdf?src-supplier=Newark; ComponentLink4Description: http://www.farnell.com/datasheets/2815955.pdf?src-supplier=Newark; Supplier Part Number 1: 497-17440-6-ND
X3 = 5TJ480000XYLBC: 8MHz SMD Crystal Resonator 18pF 70Ω ±10ppm ±30ppm -40℃~+85℃ SMD5032-4P Crystals ROHS; Manufacturer: JYJE; Manufacturer Part Number: 5TJ480000XYLBC; Footprint: Custom; ComponentLink1Description: LCSC; ComponentLink1URL: https://lcsc.com/product-detail/Crystals_JYJE-5TJ480000XYLBC_C2149247.html
X4 = NX3215SA-32.768K-STD-MUA-8: CRYSTAL 32.7680KHZ 12.5PF SMD; Manufacturer: NDK; Frequency: 32.768kHz; Frequency Tolerance: 20ppm; ESR (Equivalent Series Resistance): 70kR; Supplier 1: Digi-Key; Manufacturer Part Number: NX3215SA-32.768K-STD-MUA-8; Stock 1: 29951; Pricing 1: 1=0.68, 10=0.602, 50=0.5628, 100=0.4974, 500=0.47124, 1000=0.3927 (USD); Mount: Surface Mount; Case/Package: SMD/SMT; Number of Pins: 2; Min Operating Temperature: -40°C; Max Operating Temperature: 85°C; Package Quantity: 1000; Load Capacitance: 12.5pF; Packaging: Tape and Reel; Length: 0.126inch; Height: 0.035inch; Width: 0.059inch; Lead Free: Lead Free; ComponentLink1URL: https://media.digikey.com/pdf/Data%20Sheets/NDK%20PDFs/NX3215SA-32.768K-STD-MUA-8.pdf?src-supplier=Digi-Key; ComponentLink1Description: https://media.digikey.com/pdf/Data%20Sheets/NDK%20PDFs/NX3215SA-32.768K-STD-MUA-8.pdf?src-supplier=Digi-Key; ComponentLink2URL: http://www.ndk.com/images/products/catalog/c_NX3215SA-STD-MUA-14_e.pdf?src-supplier=Digi-Key; ComponentLink2Description: http://www.ndk.com/images/products/catalog/c_NX3215SA-STD-MUA-14_e.pdf?src-supplier=Digi-Key; Supplier Part Number 1: 644-1156-6-ND